# EAGLE design Main Board (EAGLE 9.6.2)
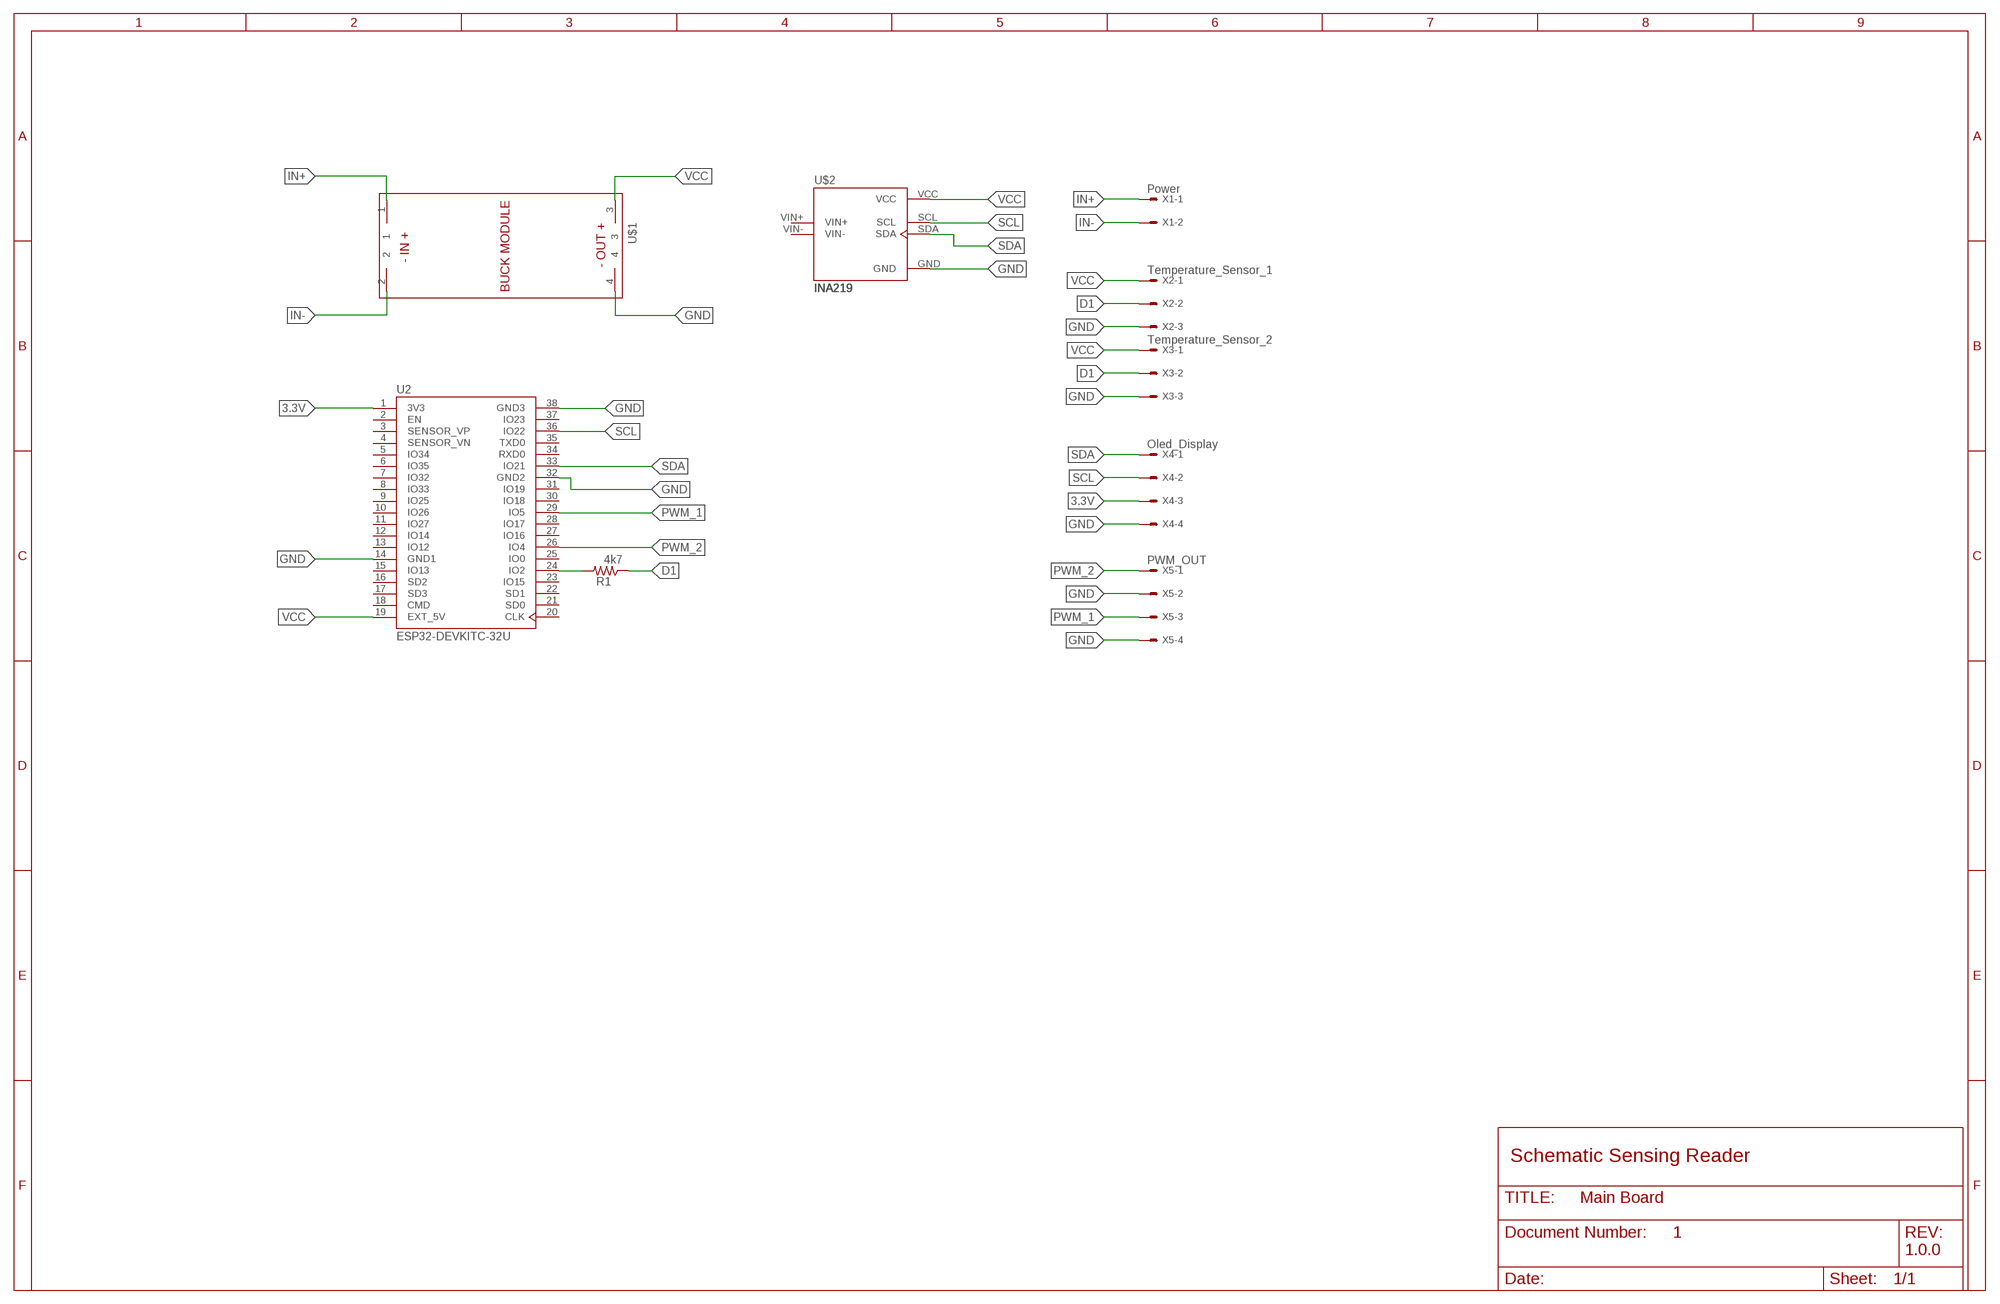
[diagram p0: schematic, sheet 1]
FRAME1 (FRAME_B_L): DESIGNER: PRATIK MAKWANA; DOC: 1; REV: 1.0.0

## Parts
R1  4k7  R-US_0207/10  [0207/10]
U2  ESP32-DEVKITC-32U  [MODULE_ESP32-DEVKITC-32U]
U$1  BUCK_MODULEWITH_SMDPADS&THROUGHHOLES  [BUCK_MODULE]
U$2  INA219  [INA219]
X1  Power  22-23-2021  [22-23-2021]
X2  Temperature_Sensor_1  22-23-2031  [22-23-2031]
X3  Temperature_Sensor_2  22-23-2031  [22-23-2031]
X4  Oled_Display  22-23-2041  [22-23-2041]
X5  PWM_OUT  22-23-2041  [22-23-2041]

## Nets
3.3V: U2.1(3V3) X4.3
D1: R1.1 X2.2 X3.2
GND: U2.14(GND1) U2.32(GND2) U2.38(GND3) U$1.4 U$2.GND X2.3 X3.3 X4.4 X5.2 X5.4
IN+: U$1.1 X1.1
IN-: U$1.2 X1.2
N$1: R1.2 U2.24(IO2)
PWM_1: U2.29(IO5) X5.3
PWM_2: U2.26(IO4) X5.1
SCL: U2.36(IO22) U$2.SCL X4.2
SDA: U2.33(IO21) U$2.SDA X4.1
VCC: U2.19(EXT_5V) U$1.3 U$2.VCC X2.1 X3.1
Unconnected: U2.2(EN) U2.3(SENSOR_VP) U2.4(SENSOR_VN) U2.5(IO34) U2.6(IO35) U2.7(IO32) U2.8(IO33) U2.9(IO25) U2.10(IO26) U2.11(IO27) U2.12(IO14) U2.13(IO12) U2.15(IO13) U2.16(SD2) U2.17(SD3) U2.18(CMD) U2.20(CLK) U2.21(SD0) U2.22(SD1) U2.23(IO15) U2.25(IO0) U2.27(IO16) U2.28(IO17) U2.30(IO18) U2.31(IO19) U2.34(RXD0) U2.35(TXD0) U2.37(IO23) U$2.VIN+ U$2.VIN-

## Notes on the sheet
- Schematic Sensing Reader

## Library data of the parts
R1 = adafruit:R-US_: RESISTOR, American symbol
U2 = ESP32-DEVKITC-32U:ESP32-DEVKITC-32U: Check availability <https://pricing.snapeda.com/parts/ESP32-DEVKITC-32U/Espressif%20Systems/view-part?ref=eda>; AVAILABILITY: In Stock; CHECK_PRICES: https://www.snapeda.com/parts/ESP32-DEVKITC-32U/Espressif+Systems/view-part/?ref=eda; DESCRIPTION: ESP32-WROOM-32UE series Transceiver; 802.11 b/g/n (Wi-Fi, WiFi, WLAN), Bluetooth® Smart Ready 4.x Dual Mode Evaluation Board; MF: Espressif Systems; MP: ESP32-DEVKITC-32U; PACKAGE: CUSTOM-38 ESPRESSIF; PRICE: None; SNAPEDA_LINK: https://www.snapeda.com/parts/ESP32-DEVKITC-32U/Espressif+Systems/view-part/?ref=snap
U$1 = BUCK_MODULE:BUCK_MODULE
U$2 = INA219:INA219
X1 = con-molex:22-23-2021: .100" (2.54mm) Center Header - 2 Pin; MF: MOLEX; MPN: 22-23-2021; OC_FARNELL: 1462926; OC_NEWARK: 25C3832
X2 X3 = con-molex:22-23-2031: .100" (2.54mm) Center Header - 3 Pin; MF: MOLEX; MPN: 22-23-2031; OC_FARNELL: 1462950; OC_NEWARK: 30C0862
X4 X5 = con-molex:22-23-2041: .100" (2.54mm) Center Header - 4 Pin; MF: MOLEX; MPN: 22-23-2041; OC_FARNELL: 1462920; OC_NEWARK: 38C0355

## Board
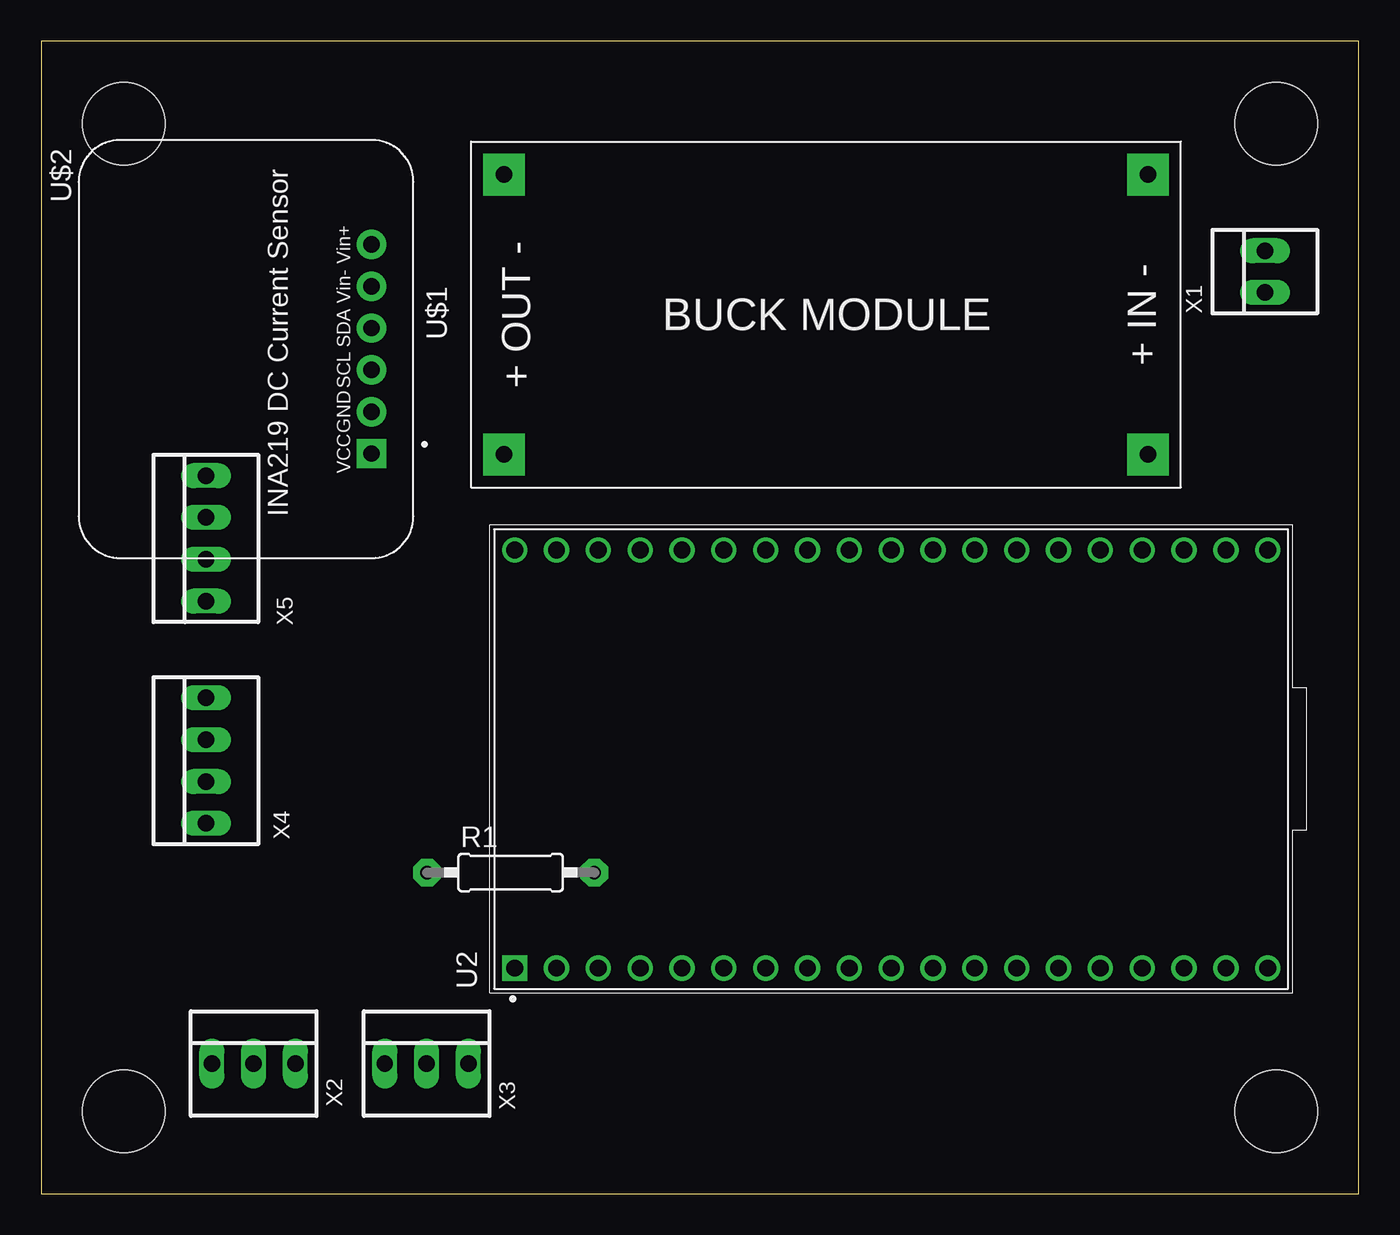
[diagram p1: board, top side]
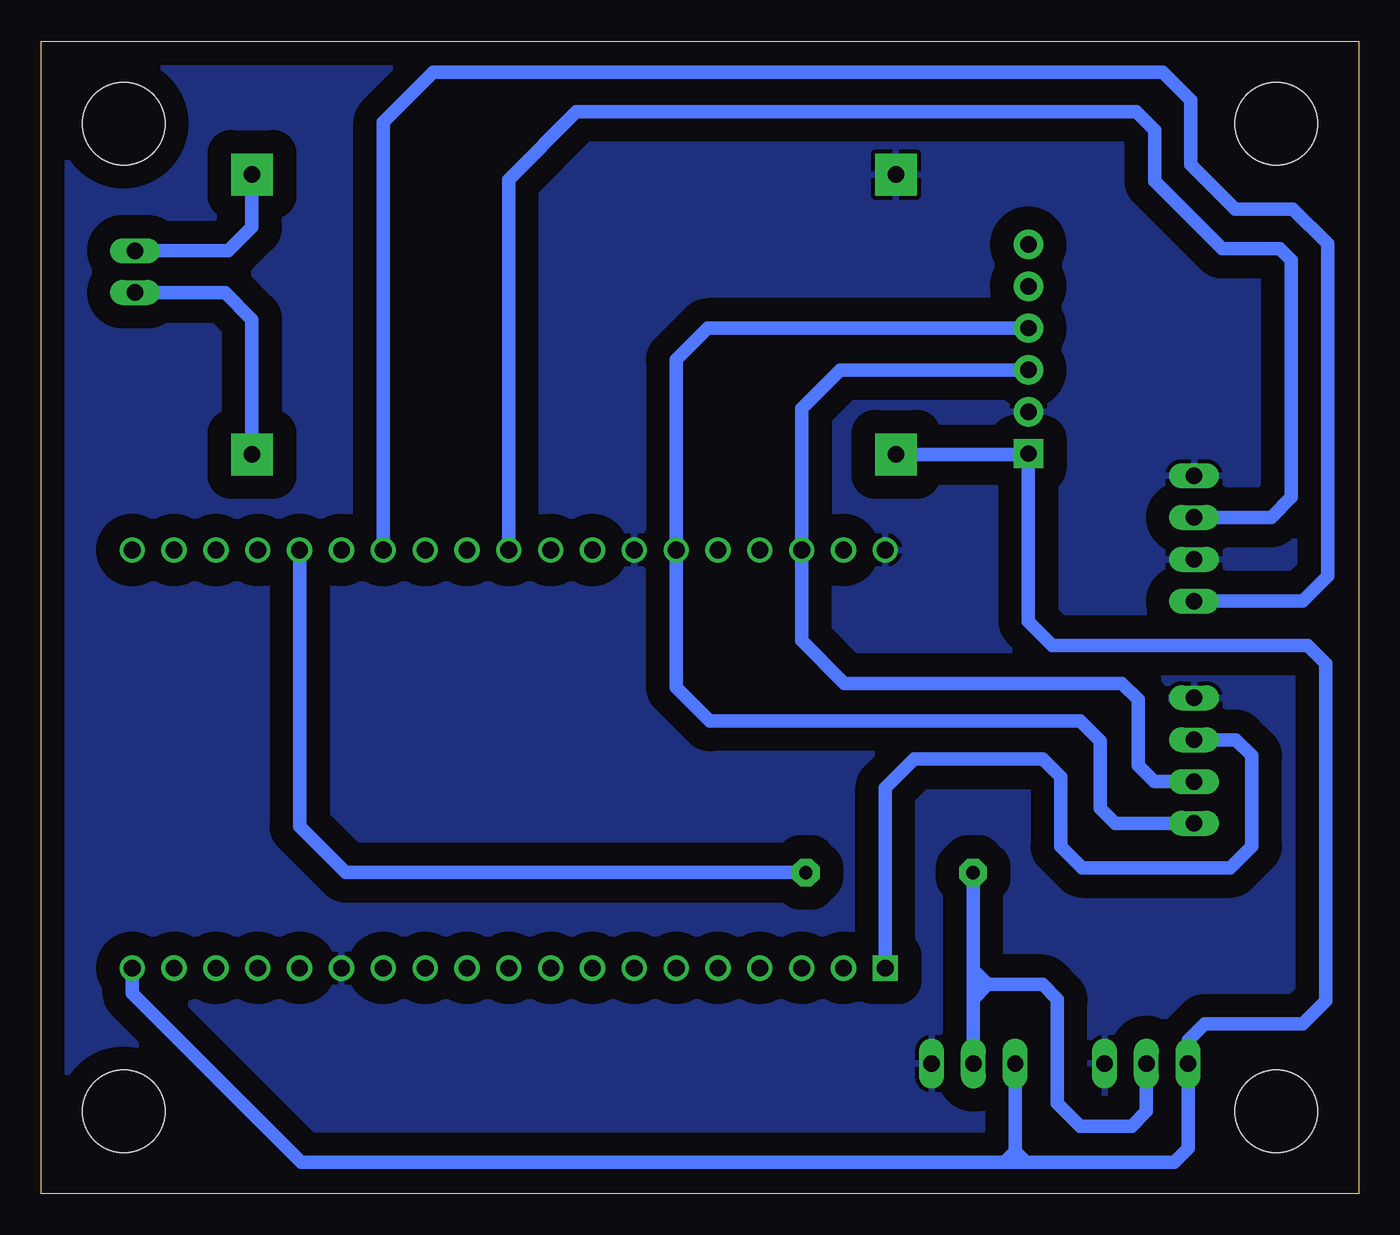
[diagram p2: board, bottom side, seen from below]

Size 80 x 70 mm. Coordinates in mm from the lower left corner, seen from the top.
Outline: 0,0 80,0 80,70 0,70 0,0
Copper layers (1*16): Top 0.035mm / dielectric 1.5mm / Bottom 0.035mm
Design rules "default": minimum track width 6mil, minimum drill 0.35mm, track to track 6mil, track to pad 6mil, pad to pad 6mil, via to via 6mil, smd to smd 6mil, copper to edge 40mil, drill to drill 6mil, minimum pad ring 10mil, minimum via ring 8mil, stop-mask expansion 4mil, vias tented up to drill 0mil, thermal gap 10mil
Holes 5 mm at 5,65 5,5 75,5 75,65

### Footprints (pad centres in the part's own frame; a part is rotated, then mirrored left to right if it is on the bottom)
0207/10 = drill 0.813 pad 1.676 octagon: 1 -5.08,0; 2 5.08,0
MODULE_ESP32-DEVKITC-32U = drill 1.02 square: 1 -12.7,22.85 | drill 1.02: 2 -12.7,20.31; 3 -12.7,17.77; 4 -12.7,15.23; 5 -12.7,12.69; 6 -12.7,10.15; 7 -12.7,7.61; 8 -12.7,5.07; 9 -12.7,2.53; 10 -12.7,-0.01; 11 -12.7,-2.55; 12 -12.7,-5.09; 13 -12.7,-7.63; 14 -12.7,-10.17; 15 -12.7,-12.71; 16 -12.7,-15.25; 17 -12.7,-17.79; 18 -12.7,-20.33; 19 -12.7,-22.87; 20 12.7,-22.87; 21 12.7,-20.33; 22 12.7,-17.79; 23 12.7,-15.25; 24 12.7,-12.71; 25 12.7,-10.17; 26 12.7,-7.63; 27 12.7,-5.09; 28 12.7,-2.55; 29 12.7,-0.01; 30 12.7,2.53; 31 12.7,5.07; 32 12.7,7.61; 33 12.7,10.15; 34 12.7,12.69; 35 12.7,15.23; 36 12.7,17.77; 37 12.7,20.31; 38 12.7,22.85
BUCK_MODULE = drill 1 pad 2.54 square: 1 -8.5,-19.5; 2 8.5,-19.5; 3 -8.5,19.6; 4 8.5,19.6
INA219 = drill 1 pad 1.778: GND 8.89,2.54; SCL 11.43,2.54; SDA 13.97,2.54; VIN+ 19.05,2.54; VIN- 16.51,2.54 | drill 1 pad 1.778 square: VCC 6.35,2.54
22-23-2021 = drill 1 long: 1 -1.27,0; 2 1.27,0
22-23-2031 = drill 1 long: 1 -2.54,0; 2 0,0; 3 2.54,0
22-23-2041 = drill 1 long: 1 -3.81,0; 2 -1.27,0; 3 1.27,0; 4 3.81,0

### Placement (x,y rotation side)
R1  28.5,19.5 0 top
U2  51.6,26.4 90 top
U$1  47.7,53.4 90 top
U$2  22.6,38.6 90 top
X1  74.3,56 90 top
X2  12.9,7.9 0 top
X3  23.4,7.9 0 top
X4  10,26.3 90 top
X5  10,39.8 90 top

### Tracks (layer width: path | path; a pad name or v marks a point on that pad's centre or on a via)
3.3V
  Bottom 0.813: X4.3 7.47,27.57 6.5,26.6 6.5,21.1 7.8,19.8 16.8,19.8 18.1,21.1 18.1,25.3 19.2,26.4 27,26.4 28.75,24.65 U2.1
D1
  Bottom 0.813: X2.2 12.9,5 13.8,4.1 16.9,4.1 18.3,5.5 18.3,11.8 19.2,12.7 22.52,12.7 | X3.2 23.42,7.92 23.42,11.8 | 23.42,11.8 23.42,13.6 | R1.1 23.42,14.1 23.42,13.6 | 22.52,12.7 23.42,11.8 | 22.52,12.7 23.42,13.6
GND
  pour Bottom (isolate 1.422): 0.2,69.9 79.9,69.9 79.9,0 0.2,0
IN+
  Bottom 0.813: X1.1 68.83,54.73 67.2,53.1 U$1.1
IN-
  Bottom 0.813: X1.2 68.63,57.27 67.2,58.7 U$1.2
N$1
  Bottom 0.813: R1.2 61.5,19.5 64.31,22.31 U2.24
PWM_1
  Bottom 0.813: U2.29 51.61,61.59 47.5,65.7 13.5,65.7 12.4,64.6 12.4,61.5 8.3,57.4 4.8,57.4 4.1,56.7 4.1,42.3 5.33,41.07 X5.3
PWM_2
  Bottom 0.813: U2.26 59.23,65.07 56.2,68.1 11.9,68.1 10.2,66.4 10.2,62.5 7.5,59.8 4,59.8 1.9,57.7 1.9,37.5 3.41,35.99 X5.1
SCL
  Bottom 0.813: U$2.SCL 31.47,50.03 33.83,47.67 U2.36 33.83,33.6 31.23,31 14.4,31 13.4,30 13.4,26 12.43,25.03 X4.2
SDA
  Bottom 0.813: U$2.SDA 39.53,52.57 41.45,50.65 U2.33 41.45,30.75 39.4,28.7 16.9,28.7 15.7,27.5 15.7,23.4 14.79,22.49 X4.1
VCC
  Bottom 0.813: U$1.3 20.11,44.9 U$2.VCC 20.06,34.76 18.6,33.3 3.1,33.3 2,32.2 2,11.7 3.4,10.3 9.36,10.3 10.36,9.3 X2.1 10.36,2.74 11.2,1.9 20.2,1.9 | 21.52,1.9 64.2,1.9 74.47,12.17 U2.19 | 21.52,1.9 20.2,1.9 | X3.1 20.86,2.56 | 20.2,1.9 20.86,2.56 | 20.86,2.56 21.52,1.9

### Text on the board
tValues: IN- | IN+ | GND | PWM_1 | GND | PWM_2 | GND | 3.3V | SCL | SDA | VCC | DATA | GND | VCC | DATA | GND